# EAGLE schematic LoraWAN_Platine_schematic (EAGLE 7.7.0)
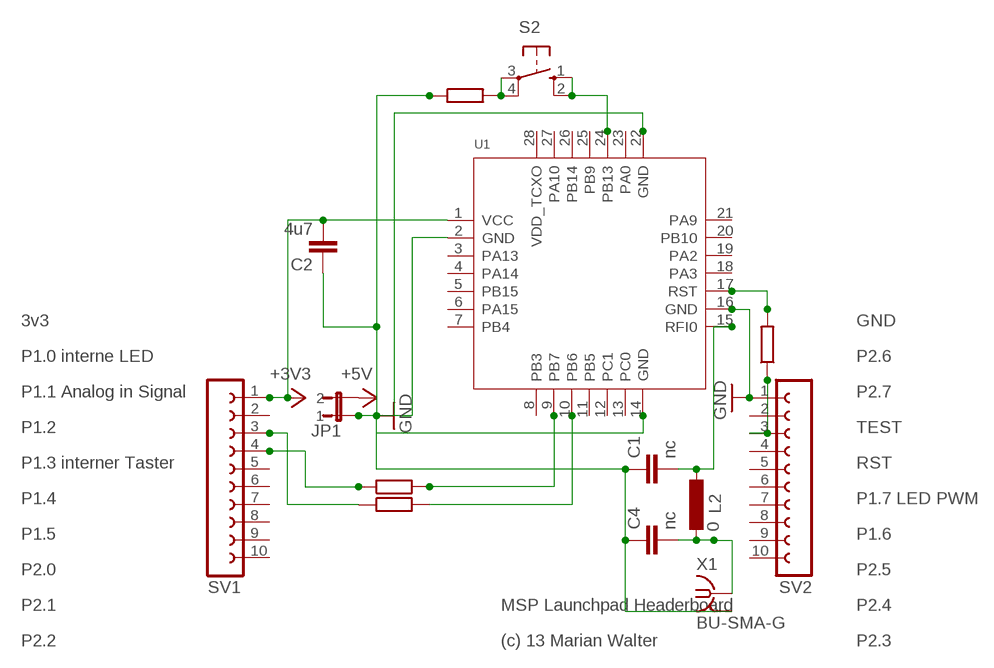
[diagram p0: schematic, sheet 1]

## Parts
C1  nc  C-EUC0805  [C0805]
C2  4u7  C-EUC1206  [C1206]
C4  nc  C-EUC0805  [C0805]
JP1  JP1E  [JP1]
L2  0  L-EUL1812  [L1812]
R1  22  R-EU_0204/7  [0204/7]
R2  22  R-EU_0204/7  [0204/7]
R3  22  R-EU_0204/7  [0204/7]
R4  1k  R-EU_0204/7  [0204/7]
S2  10-XX  [B3F-10XX]
SV1  FE10-1  [FE10]
SV2  FE10-1  [FE10]
U1  MODULE_LORA_E5  [MODULE28P-1.25-12X12X2.5MM]
X1  BU-SMA-G  [BU-SMA-G]

## Nets
+3V3: C2.2 SV1.1 U1.1(VCC)
+5V: JP1.2
GND: C1.1 C2.1 C4.1 JP1.1 R4.1 SV2.1 U1.2(GND) U1.14(GND) U1.16(GND) U1.22(GND) X1.2 X1.3 X1.4 X1.5
N$1: C1.2 L2.1 U1.15(RFI0)
N$2: R2.2 U1.9(PB7)
N$3: R2.1 SV1.4
N$4: R1.2 U1.10(PB6)
N$5: R1.1 SV1.3
N$6: R3.2 U1.17(RST)
N$7: R3.1 SV2.3
N$8: C4.2 L2.2 X1.1
N$9: R4.2 S2.3(P) S2.4(P1)
N$12: S2.1(S) S2.2(S1) U1.24(PB13)
Unconnected: SV1.2 SV1.5 SV1.6 SV1.7 SV1.8 SV1.9 SV1.10 SV2.2 SV2.4 SV2.5 SV2.6 SV2.7 SV2.8 SV2.9 SV2.10 U1.3(PA13) U1.4(PA14) U1.5(PB15) U1.6(PA15) U1.7(PB4) U1.8(PB3) U1.11(PB5) U1.12(PC1) U1.13(PC0) U1.18(PA3) U1.19(PA2) U1.20(PB10) U1.21(PA9) U1.23(PA0) U1.25(PB9) U1.26(PB14) U1.27(PA10) U1.28(VDD_TCXO)

## Notes on the sheet
- 3v3 | GND
- P1.0 interne LED | P2.6
- P1.1 Analog in Signal | P2.7
- P1.2 | TEST
- P1.3 interner Taster | RST
- P1.4 | P1.7 LED PWM
- P1.5 | P1.6
- P2.0 | P2.5
- P2.1 | MSP Launchpad Headerboard | P2.4
- P2.2 | (c) 13 Marian Walter | P2.3

## Library data of the parts
C1 C2 C4 = rcl:C-EU: CAPACITOR, European symbol; SPICEPREFIX: C
JP1 = jumper:JP1E: JUMPER
L2 = rcl:L-EU: INDUCTOR, European symbol; SPICEPREFIX: L
R1-R4 = rcl:R-EU_: RESISTOR, European symbol; SPICEPREFIX: R
S2 = switch-omron:10-XX: OMRON SWITCH; MPN: B3F-1000; OC_FARNELL: 176432; OC_NEWARK: 36M3542
SV1 SV2 = con-lsta:FE10-1: FEMALE HEADER
U1 = LORA-E5_Eagle_Library:MODULE_LORA_E5
X1 = con-coax:BU-SMA-G: FEMALE SMA CONNECTOR Radiall distributor RS 193-9117; OC_FARNELL: unknown; OC_NEWARK: unknown